# EasyEDA Pro project LinTOS_2026-10-19.epro, schematic Schematic1_1
Assembly Variant: Basic; Board Name: Board1; Create Date: 2026-08-16; Page Name: P1; Project Name: ESP32-S3-RLCD-BBK; Schematic Name: Schematic1; Update Date: 2026-08-16; Company: 嘉立创EDA; Page Size: A4; Version: V1.0
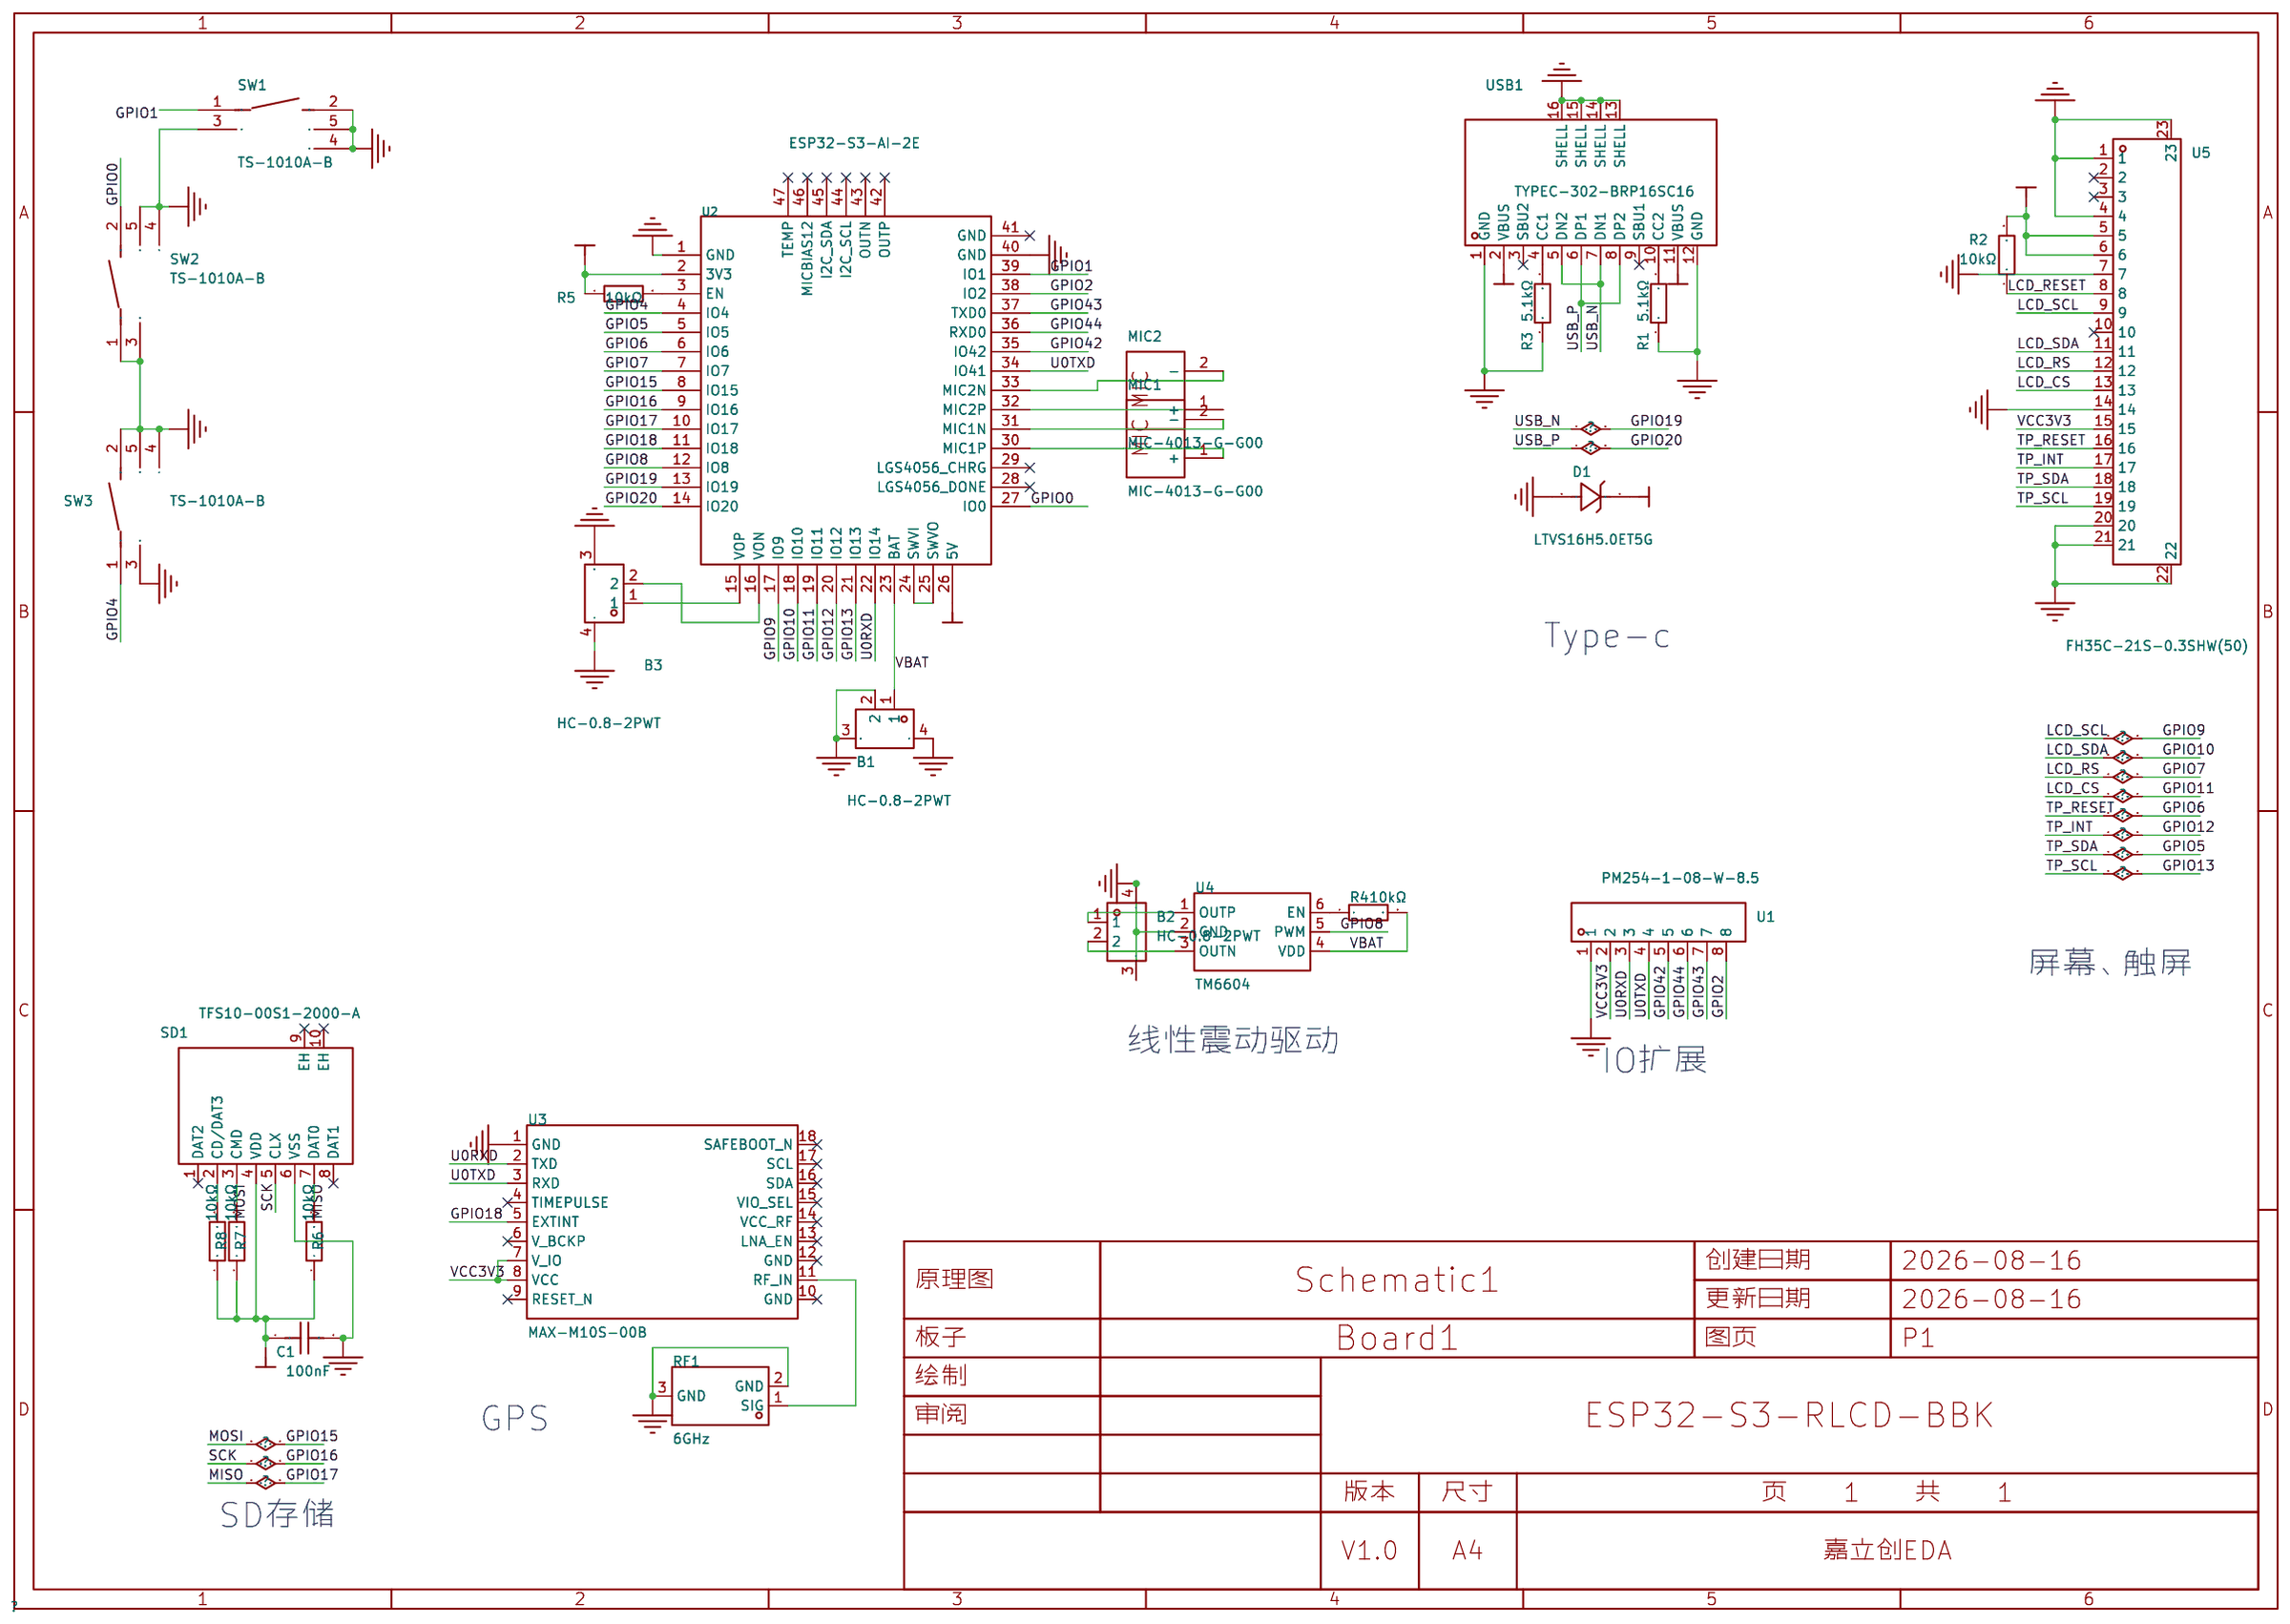
[diagram p1: schematic sheet]

## Parts
B1  HC-0.8-2PWT  [CONN-SMD_2P-P0.80_HCTL_HC-0.8-2PWT]
B2  HC-0.8-2PWT  [CONN-SMD_2P-P0.80_HCTL_HC-0.8-2PWT]
B3  HC-0.8-2PWT  [CONN-SMD_2P-P0.80_HCTL_HC-0.8-2PWT]
C1  100nF  [C0603]
D1  LTVS16H5.0ET5G  [DFN1610-2L_L1.6-W1.0-P1.10-RD]
MIC1  MIC-4013-G-G00  [MIC-SMD_BD4.0-4013_SMDA]
MIC2  MIC-4013-G-G00  [MIC-SMD_BD4.0-4013_SMDA]
R1  5.1kΩ  [R0603]
R2  10kΩ  [R0603]
R3  5.1kΩ  [R0603]
R4  10kΩ  [R0603]
R5  10kΩ  [R0603]
R6  10kΩ  [R0603]
R7  10kΩ  [R0603]
R8  10kΩ  [R0603]
RF1  6GHz  [IPEX-SMD_BWIPX-1-001E]
SD1  TFS10-00S1-2000-A  [SIM-SMD_TFS10-00S1-2000-A]
SW1  TS-1010A-B  [SW-SMD_TS-1010A-B]
SW2  TS-1010A-B  [SW-SMD_TS-1010A-B]
SW3  TS-1010A-B  [SW-SMD_TS-1010A-B]
U1  PM254-1-08-W-8.5  [HDR-TH_8P-P2.54-H-F-W10.0-N]
U2  ESP32-S3-AI-2E  [ESP32-S3-AI-2E]
U3  MAX-M10S-00B  [SMD-18_L10.1-W9.7-P1.10-TL_SKG09F]
U4  TM6604  [SOT-23-6_L2.9-W1.6-P0.95-LS2.8-BR]
U5  FH35C-21S-0.3SHW(50)  [FPC-SMD_21P-P0.30_FH35C-21S-0.3SHW-50]
USB1  TYPEC-302-BRP16SC16  [USB-C-SMD_TYPEC-302-BRP16SC16]

## Library data of the parts
B1-B3 = HC-0.8-2PWT: 插针结构:1x2P;间距:0.8mm;安装方式:卧贴;参考系列:-;总PIN数:2P;排数:1;每排PIN数:2;行距:-;额定电流:500mA;触头材质:磷青铜;触头镀层:锡;工作温度范围:-25℃~+85℃;; LCSC Part Name: 1x2P 间距:0.8mm 卧贴; Supplier Part: C2845343; Manufacturer: HCTL(华灿天禄); Supplier Footprint: SMD,P=0.8mm,卧贴; JLCPCB Part Class: Extended Part; Datasheet: https://atta.szlcsc.com/upload/public/pdf/source/20230707/4723FD87455A1B942ECF59815D4E1AAF.pdf; Supplier: LCSC; Pins Structure: 1x2P; Pitch: 0.8mm; Mounting Style: 卧贴; Number of Pins: 2P; Number of Rows: 1; Number of PINs Per Row: 2; Current Rating (Max): 500mA; Contact Material: 磷青铜; Contact Plating: 锡; Operating Temperature Range: -25℃~+85℃; Rated Voltage (Max): 30V; Plastic Material: LCP; Flame Retardant Rating: UL94V-0; Supplementary Features: 辅助焊脚; Z-Height of the Board: 1.85mm; X-Length of Bottom Edge on Board (Spacing Line): 3.8mm; Y-Width of Bottom Edge on Board: 2.8mm; Check: true
C1 = FCC0603B104K500CT: 容值:100nF;精度:±10%;额定电压:50V;温度系数:X7R;; LCSC Part Name: 100nF ±10% 50V; Supplier Part: C5137636; Manufacturer: FOJAN(富捷); Supplier Footprint: 0603; JLCPCB Part Class: Extended Part; Datasheet: https://item.szlcsc.com/datasheet/FCC0603B104K500CT/5747088.html; Supplier: LCSC; Tolerance: ±10%; Voltage Rating: 50V; Temperature Coefficient: X7R; Operating Temperature: -55℃~+125℃
D1 = LTVS16H5.0ET5G: 极性:单向;反向截止电压(Vrwm):5V;钳位电压:10.8V;峰值脉冲电流(Ipp):150A@8/20us;峰值脉冲功率(Ppp):1.8kW@8/20us;击穿电压:7.1V;; LCSC Part Name: 单向 5V截止 峰值浪涌电流：150A@8/20us; Supplier Part: C383280; Manufacturer: LRC(乐山无线电); Supplier Footprint: DFN1610-2; JLCPCB Part Class: Extended Part; Datasheet: https://item.szlcsc.com/datasheet/LTVS16H5.0ET5G/356587.html; Supplier: LCSC; Polarity: 单向; Reverse Stand-Off Voltage (Vrwm): 5V; Clamping Voltage: 10.8V; Peak Pulse Current (Ipp): 150A@8/20us; Peak Pulse Power Dissipation (Ppp): 1.8kW@8/20us; Voltage - Breakdown: 7.1V; Reverse Leakage Current (Ir): 600nA; level of protection: IEC 61000-4-2; Junction Capacitance: 800pF; Check: true
MIC1 MIC2 = MIC-4013-G-G00: 指向性:-;输出阻抗:-;信噪比:-;灵敏度:-;; LCSC Part Name: 4mm绿板高温绑定无电容麦克风; Supplier Part: C42371093; Manufacturer: SAMZO(三佐); Supplier Footprint: SMD,D=4mm; JLCPCB Part Class: Extended Part; Datasheet: https://item.szlcsc.com/datasheet/MIC-4013-G-G00/44248913.html; Supplier: LCSC; Voltage - Supply: 2V; Diameter(φD): 4mm; Height: 1.3mm; Mounting Type: 贴片
R1 R3 = 0603WAF5101T5E: 电阻类型:厚膜电阻;阻值:5.1kΩ;精度:±1%;功率:100mW;工作电压:75V;温度系数:±100ppm/℃;; LCSC Part Name: 5.1kΩ ±1% 100mW 厚膜电阻; Supplier Part: C23186; Manufacturer: UNI-ROYAL(厚声); Supplier Footprint: 0603; JLCPCB Part Class: Basic Part; Datasheet: https://item.szlcsc.com/datasheet/0603WAF5101T5E/23913.html; Supplier: LCSC; Type: 厚膜电阻; Tolerance: ±1%; Power(Watts): 100mW; Voltage-Supply(Max): 75V; Temperature Coefficient: ±100ppm/℃; Operating Temperature: -55℃~+155℃; Check: true
R2 R4 R6-R8 = 0603WAF1002T5E: 电阻类型:厚膜电阻;阻值:10kΩ;精度:±1%;功率:100mW;工作电压:75V;温度系数:±100ppm/℃;; LCSC Part Name: 厚膜电阻 10kΩ ±1% 100mW; Supplier Part: C25804; Manufacturer: UNI-ROYAL(厚声); Supplier Footprint: 0603; JLCPCB Part Class: Basic Part; Datasheet: https://item.szlcsc.com/datasheet/0603WAF1002T5E/26547.html; Supplier: LCSC; Type: 厚膜电阻; Tolerance: ±1%; Power(Watts): 100mW; Voltage-Supply(Max): 75V; Temperature Coefficient: ±100ppm/℃; Operating Temperature: -55℃~+155℃
R5 = 0603WAF1002T5E: 电阻类型:厚膜电阻;阻值:10kΩ;精度:±1%;功率:100mW;工作电压:75V;温度系数:±100ppm/℃;; LCSC Part Name: 厚膜电阻 10kΩ ±1% 100mW; Supplier Part: C25804; Manufacturer: UNI-ROYAL(厚声); Supplier Footprint: 0603; JLCPCB Part Class: Basic Part; Datasheet: https://item.szlcsc.com/datasheet/0603WAF1002T5E/26547.html; Supplier: LCSC; Type: 厚膜电阻; Tolerance: ±1%; Power(Watts): 100mW; Voltage-Supply(Max): 75V; Temperature Coefficient: ±100ppm/℃; Operating Temperature: -55℃~+155℃; Check: true
RF1 = BWIPX-1-001E: 连接器类型:板端;接口类型:内针;端口数量:1;接口直径:2mm;接口长度/高度:1.25mm;频率:6GHz;射频系列:IPEX;阻抗:50Ω;样式:-;工作温度:-40℃~+85℃;; LCSC Part Name: 内针 IPEX; Supplier Part: C496552; Manufacturer: BAT WIRELESS(蝙蝠无线); Supplier Footprint: SMD; JLCPCB Part Class: Extended Part; Datasheet: https://item.szlcsc.com/datasheet/BWIPX-1-001E/508501.html; Supplier: LCSC; Connector Type: 板端; Interface: 内针; Number of Ports: 1; Interface Diameter: 2mm; Interface Length/Height: 1.25mm; RF Series: IPEX; Impedance: 50Ω; Operating Temperature Range: -40℃~+85℃
SD1 = TFS10-00S1-2000-A: 卡连接方式:拔插式;卡类型:MicroSD卡(TF卡);连接器类型:卡座;本体最大高度:1.9mm;工作温度:-25℃~+90℃;; LCSC Part Name: 拔插式 MicroSD卡(TF卡) 卡座; Supplier Part: C22357902; Manufacturer: XFCN(兴飞); Supplier Footprint: SMD; JLCPCB Part Class: Extended Part; Datasheet: https://item.szlcsc.com/datasheet/TFS10-00S1-2000-A/23793223.html; Supplier: LCSC; Card Connection Mode: 拔插式; Card Type: MicroSD卡(TF卡); Connector Type: 卡座; Additional Card Detection Pins: 无; Height Above Board: 1.9mm; Operating Temperature: -25℃~+90℃
SW1-SW3 = TS-1010A-B: 电路结构:单刀单掷;按钮形状:矩形按钮;作用力:1.6N;安装方式:卧贴;开关长度:4.5mm;开关宽度:3.5mm;开关高度:1.7mm;带支架:不带支架;触点电流:50mA;额定电压:12V;带灯:无;工作寿命:10万次;; LCSC Part Name: 4.5*3.5*1.7mm 卧贴 轻触开关; Supplier Part: C381059; Manufacturer: XKB Connection(中国星坤); Supplier Footprint: SMD,4.5x3.5mm; JLCPCB Part Class: Extended Part; Datasheet: https://item.szlcsc.com/datasheet/TS-1010A-B/353291.html; Supplier: LCSC; Circuit: 单刀单掷; Actuator Style: 矩形按钮; Operating Force: 1.6N; Mounting Type: 卧贴; Length: 4.5mm; Width: 3.5mm; Switch Height: 1.7mm; with Bracket: 不带支架; Contact Current: 50mA; Voltage Rating: 12V; Actuator/Cap Color: 黑色; With Lamp: 无; Life: 10万次; Operating Temperature: -30℃~+85℃
U1 = PM254-1-08-W-8.5: 插孔结构:1x8P;间距:2.54mm;行距:-;圆孔/方孔:方孔;安装方式:弯插;排数:单排;总孔位数:8P;额定电流:3A;额定电压:-;插孔方向:侧面;塑高:8.5mm;触头材质:铜合金;工作温度:-40℃~+105℃;; LCSC Part Name: 1x8P 间距:2.54mm 弯插; Supplier Part: C2897390; Manufacturer: HCTL(华灿天禄); Supplier Footprint: 弯插,P=2.54mm; JLCPCB Part Class: Extended Part; Datasheet: https://item.szlcsc.com/datasheet/PM254-1-08-W-8.5/3142395.html; Supplier: LCSC; Holes Structure: 1x8P; Pitch: 2.54mm; Circular Hole / Square Hole: 方孔; Mounting Type: 弯插; Number of Rows: 单排; Number of Positions: 8P; Current Rating: 3A; Holes Direction: 侧面; Insulation Height: 8.5mm; Contact Material: 铜合金; Operating Temperature: -40℃~+105℃
U2 = ESP32-S3-AI-2E: Manufacturer: 格子派; Supplier Footprint: SMD,18x19.5mm; JLCPCB Part Class: 扩展库
U3 = MAX-M10S-00B: 该模块采用u-blox M10标准精度GNSS平台，为所有L1 GNSS信号提供出色的灵敏度和捕获时间。支持同时接收四个GNSS（GPS、GLONASS、伽利略和北斗）。大量可见卫星使接收器能够选择最佳信号，这最大限度地提高了位置可用性，特别是在诸如深城市峡谷等具有挑战性的条件下。u-blox Super-S（超信号）技术提供了出色的射频灵敏度，并且可以在使用小天线或非视距场景中提高动态定位精度; LCSC Part Name: 标准精度GNSS模块; Supplier Part: C4153167; Manufacturer: U-BLOX(优北罗); Supplier Footprint: LCC-18(9.7x10.1); JLCPCB Part Class: Extended Part; Datasheet: https://item.szlcsc.com/datasheet/MAX-M10S-00B/4722633.html; Supplier: LCSC; Features: 热启动加速；短路检测
U4 = TM6604_C22362584: 灵活触控反馈/Vibra驱动程序1.8V兼容，5V容限数字引脚; LCSC Part Name: 线性振动马达驱动 停产; Supplier Part: C22362584; Manufacturer: TM(天微); Supplier Footprint: SOT-23-6; JLCPCB Part Class: Extended Part; Datasheet: https://item.szlcsc.com/datasheet/TM6604/23808696.html; Supplier: LCSC; Voltage - Supply: 2.7V~5.2V; Quiescent Current(Iq): 1.7mA; Operating Temperature: -40℃~+85℃; Features: 软开关；主动制动功能；电流采样/调节功能
U5 = FH35C-21S-0.3SHW(50): 锁定特性:翻盖式;触点类型:双侧触点/上下接;触点数量:21P;间距:0.3mm;安装方式:卧贴;工作温度:-55℃~+85℃;; LCSC Part Name: 间距:0.3mm P数:21P 翻盖式 双侧触点/上下接; Supplier Part: C5242964; Manufacturer: HRS(广濑); Supplier Footprint: SMD,P=0.3mm,卧贴; JLCPCB Part Class: Extended Part; Datasheet: https://item.szlcsc.com/datasheet/FH35C-21S-0.3SHW(50)/5951809.html; Supplier: LCSC; Locking Feature: 翻盖式; Contact Type: 双侧触点/上下接; Number of Contacts: 21P; Pitch: 0.3mm; Mounting Type: 卧贴; FFC, FCB Thickness: 0.2mm; Height Above Board: 0.88mm; Contact Material: 磷青铜; Contact Plating: 金; Operating Temperature: -55℃~+85℃; Check: true
USB1 = TYPEC-302-BRP16SC16: 连接器类型:Type-C;协议标准:USB 3.1;公母:母;安装方式:沉板;触点数量:16P;端口数量:1;额定电流 - 电源:5A;工作温度:-45℃~+85℃;; LCSC Part Name: Type-C 母 沉板; Supplier Part: C2835313; Manufacturer: XUNPU(讯普); Supplier Footprint: SMD; JLCPCB Part Class: Extended Part; Datasheet: https://item.szlcsc.com/datasheet/TYPEC-302-BRP16SC16/2998971.html; Supplier: LCSC; Connector Type: Type-C; Protocol Standard: USB 3.1; Gender: 母; Mounting Type: 沉板; Number of Contacts: 16P; Number of Ports: 1; Current Rating-Power: 5A; Voltage Rating: 5V; Connect-Disconnect Life: 1万次; Length: 6.5mm; Detection color: 黑色; Operating Temperature: -45℃~+85℃

## Nets
+5V: D1.1(C) U2.26(5V) USB1.2(VBUS) USB1.11(VBUS)
GND: B1.2 B1.3 B1.4 B2.3 B2.4 B3.3 B3.4 C1.2 D1.2(A) R1.1 R3.1 RF1.2(GND) RF1.3(GND) SD1.6(VSS) SW1.2 SW1.3 SW1.4 SW1.5 SW2.1 SW2.3 SW2.4 SW2.5 SW3.2 SW3.3 SW3.4 SW3.5 U1.1 U2.1(GND) U2.40(GND) U3.1(GND) U4.2(GND) U5.1 U5.4 U5.7 U5.14 U5.20 U5.21 U5.22 U5.23 USB1.1(GND) USB1.12(GND) USB1.13(SHELL) USB1.14(SHELL) USB1.15(SHELL) USB1.16(SHELL)
VBAT: B1.1 R4.2 U2.23(BAT) U4.4(VDD)
VCC3V3: C1.1 R2.2 R5.1 R6.1 R7.1 R8.1 SD1.4(VDD) U1.2 U2.2(3V3) U3.7(V_IO) U3.8(VCC) U5.5 U5.6 U5.15
GPIO0: SW2.2 U2.27(IO0)
GPIO1: SW1.1 U2.39(IO1)
GPIO2: U1.8 U2.38(IO2)
GPIO4: SW3.1 U2.4(IO4)
GPIO5: U2.5(IO5) U5.18
GPIO6: U2.6(IO6) U5.16
GPIO7: U2.7(IO7) U5.12
GPIO8: U2.12(IO8) U4.5(PWM)
GPIO9: U2.17(IO9) U5.9
GPIO10: U2.18(IO10) U5.11
GPIO11: U2.19(IO11) U5.13
GPIO12: U2.20(IO12) U5.17
GPIO13: U2.21(IO13) U5.19
GPIO15: R7.2 SD1.3(CMD) U2.8(IO15)
GPIO16: SD1.5(CLX) U2.9(IO16)
GPIO17: R6.2 SD1.7(DAT0) U2.10(IO17)
GPIO18: U2.11(IO18) U3.5(EXTINT)
GPIO19: U2.13(IO19) USB1.5(DN2) USB1.7(DN1)
GPIO20: U2.14(IO20) USB1.6(DP1) USB1.8(DP2)
GPIO42: U1.5 U2.35(IO42)
GPIO43: U1.7 U2.37(TXD0)
GPIO44: U1.6 U2.36(RXD0)
LCD_RESET: R2.1 U5.8
U0RXD: U1.3 U2.22(IO14) U3.2(TXD)
U0TXD: U1.4 U2.34(IO41) U3.3(RXD)
$1N229: B2.2 U4.3(OUTN)
$1N390: R3.2 USB1.4(CC1)
$1N401: RF1.1(SIG) U3.11(RF_IN)
$1N406: B3.1 U2.15(VOP)
$1N487: B2.1 U4.1(OUTP)
$1N559: R1.2 USB1.10(CC2)
$1N564: R5.2 U2.3(EN)
$1N576: B3.2 U2.16(VON)
$1N584: U2.24(SWVI) U2.25(SWVO)
$1N623: R4.1 U4.6(EN)
$1N628: MIC1.2(-) U2.31(MIC1N)
$1N629: MIC1.1(+) U2.30(MIC1P)
$1N646: R8.2 SD1.2(CD/DAT3)
$1N654: MIC2.1(+) U2.32(MIC2P)
$1N655: MIC2.2(-) U2.33(MIC2N)

Not connected (* = marked no-connect by the designer): SD1 1(DAT2)* 8(DAT1)* 9(EH)* 10(EH)*; U2 28(LGS4056_DONE)* 29(LGS4056_CHRG)* 41(GND)* 42(OUTP)* 43(OUTN)* 44(I2C_SCL)* 45(I2C_SDA)* 46(MICBIAS12)* 47(TEMP)*; U3 4(TIMEPULSE)* 6(V_BCKP)* 9(RESET_N)* 10(GND)* 12(GND)* 13(LNA_EN)* 14(VCC_RF)* 15(VIO_SEL)* 16(SDA)* 17(SCL)* 18(SAFEBOOT_N)*; U5 2* 3* 10*; USB1 3(SBU2)* 9(SBU1)*

## Notes on the sheet
- Type-c
- 屏幕、触屏
- 线性震动驱动
- IO扩展
- GPS
- SD存储
